# Altium schematic sheet TopSheet.SchDoc
size A4; SheetNumber: 1; SheetTotal: 4
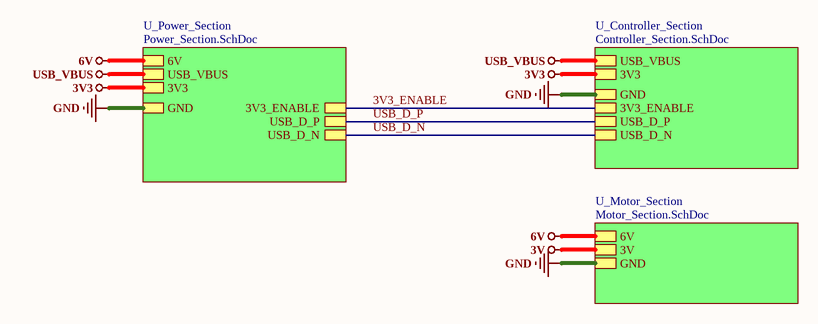
[diagram p0: TopSheet.SchDoc]

## Sub-sheets
U_Controller_Section = Controller_Section.SchDoc: GND, USB_VBUS, 3V3, USB_D_N, USB_D_P, 3V3_ENABLE
U_Motor_Section = Motor_Section.SchDoc: 3V, 6V, GND
U_Power_Section = Power_Section.SchDoc: GND, USB_VBUS, 3V3, 6V, USB_D_P, USB_D_N, 3V3_ENABLE

## Nets
3V: sheet U_Motor_Section/3V
3V3: sheet U_Power_Section/3V3, sheet U_Controller_Section/3V3
6V: sheet U_Motor_Section/6V, sheet U_Power_Section/6V
GND: sheet U_Motor_Section/GND, sheet U_Power_Section/GND, sheet U_Controller_Section/GND
USB_VBUS: sheet U_Power_Section/USB_VBUS, sheet U_Controller_Section/USB_VBUS
3V3_ENABLE: sheet U_Power_Section/3V3_ENABLE, sheet U_Controller_Section/3V3_ENABLE
USB_D_N: sheet U_Power_Section/USB_D_N, sheet U_Controller_Section/USB_D_N
USB_D_P: sheet U_Power_Section/USB_D_P, sheet U_Controller_Section/USB_D_P

## Notes on the sheet
- File:
- Title:
- Date:
- Page
- Num:
- Total:
- Drawn By: Huzaifa Ali